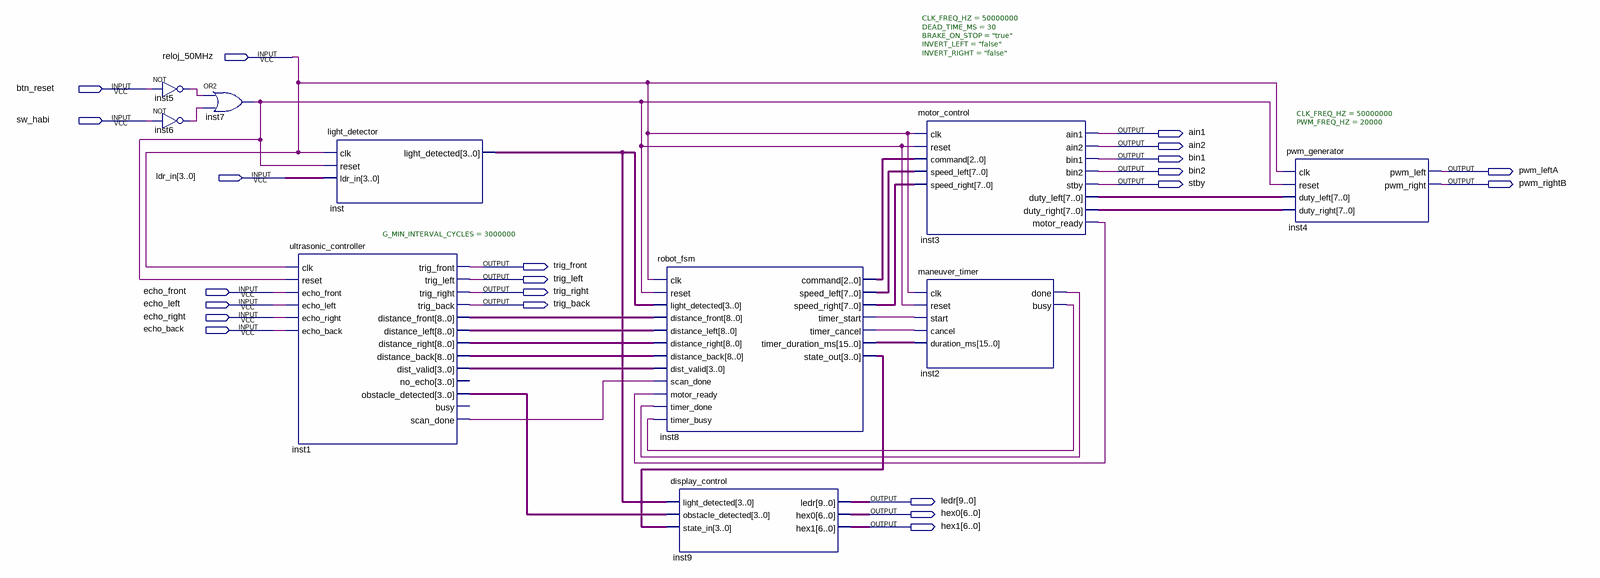
[diagram p0: schematic sheet]
// Quartus schematic robot_system.bdf as structural Verilog: 10 symbols, 22 pins
module robot_system (
  input  reloj_50MHz,
  input  btn_reset,
  input  sw_habi,
  input  [3:0] ldr_in,
  input  echo_front,
  input  echo_left,
  input  echo_right,
  input  echo_back,
  output ain1,
  output ain2,
  output bin1,
  output bin2,
  output pwm_leftA,
  output stby,
  output pwm_rightB,
  output trig_front,
  output trig_left,
  output trig_right,
  output trig_back,
  output [9:0] ledr,
  output [6:0] hex0,
  output [6:0] hex1
);

  wire inst1_scan_done, inst2_busy, inst2_done, inst3_motor_ready, inst5_out, inst6_out, inst7_out,
       inst8_timer_cancel, inst8_timer_start;
  wire [2:0] inst8_command;
  wire [3:0] inst1_dist_valid, inst1_obstacle_detected, inst8_state_out, inst_light_detected;
  wire [7:0] inst3_duty_left, inst3_duty_right, inst8_speed_left, inst8_speed_right;
  wire [8:0] inst1_distance_back, inst1_distance_front, inst1_distance_left, inst1_distance_right;
  wire [15:0] inst8_timer_duration_ms;

  not inst5 (inst5_out, btn_reset);
  not inst6 (inst6_out, sw_habi);
  or inst7 (inst7_out, inst5_out, inst6_out);
  ultrasonic_controller #(.G_MIN_INTERVAL_CYCLES(3000000)) inst1 (
    .clk(reloj_50MHz), .reset(inst7_out), .echo_front(echo_front), .echo_left(echo_left),
    .echo_right(echo_right), .echo_back(echo_back), .trig_front(trig_front), .trig_left(trig_left),
    .trig_right(trig_right), .trig_back(trig_back), .distance_front(inst1_distance_front),
    .distance_left(inst1_distance_left), .distance_right(inst1_distance_right),
    .distance_back(inst1_distance_back), .dist_valid(inst1_dist_valid),
    .obstacle_detected(inst1_obstacle_detected), .scan_done(inst1_scan_done));  // open: no_echo, busy
  light_detector inst (.clk(reloj_50MHz), .reset(inst7_out), .ldr_in(ldr_in), .light_detected(inst_light_detected));
  robot_fsm inst8 (
    .clk(reloj_50MHz), .reset(inst7_out), .light_detected(inst_light_detected),
    .distance_front(inst1_distance_front), .distance_left(inst1_distance_left),
    .distance_right(inst1_distance_right), .distance_back(inst1_distance_back),
    .dist_valid(inst1_dist_valid), .scan_done(inst1_scan_done), .motor_ready(inst3_motor_ready),
    .timer_done(inst2_done), .timer_busy(inst2_busy), .command(inst8_command), .speed_left(inst8_speed_left),
    .speed_right(inst8_speed_right), .timer_start(inst8_timer_start), .timer_cancel(inst8_timer_cancel),
    .timer_duration_ms(inst8_timer_duration_ms), .state_out(inst8_state_out));
  display_control inst9 (
    .light_detected(inst_light_detected), .obstacle_detected(inst1_obstacle_detected),
    .state_in(inst8_state_out), .ledr(ledr), .hex0(hex0), .hex1(hex1));
  motor_control #(.CLK_FREQ_HZ(50000000), .DEAD_TIME_MS(30), .BRAKE_ON_STOP("true"), .INVERT_LEFT("false"), .INVERT_RIGHT("false")) inst3 (
    .clk(reloj_50MHz), .reset(inst7_out), .command(inst8_command), .speed_left(inst8_speed_left),
    .speed_right(inst8_speed_right), .ain1(ain1), .ain2(ain2), .bin1(bin1), .bin2(bin2), .stby(stby),
    .duty_left(inst3_duty_left), .duty_right(inst3_duty_right), .motor_ready(inst3_motor_ready));
  maneuver_timer inst2 (
    .clk(reloj_50MHz), .reset(inst7_out), .start(inst8_timer_start), .cancel(inst8_timer_cancel),
    .duration_ms(inst8_timer_duration_ms), .done(inst2_done), .busy(inst2_busy));
  pwm_generator #(.CLK_FREQ_HZ(50000000), .PWM_FREQ_HZ(20000)) inst4 (
    .clk(reloj_50MHz), .reset(inst7_out), .duty_left(inst3_duty_left), .duty_right(inst3_duty_right),
    .pwm_left(pwm_leftA), .pwm_right(pwm_rightB));
endmodule
